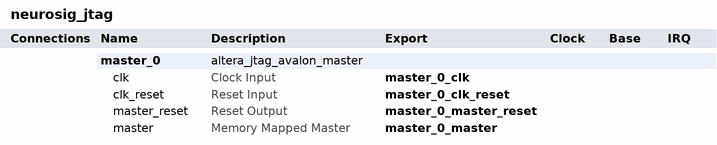
[diagram p0: system contents]
# Platform Designer (Qsys) system neurosig_jtag, Cyclone V 5CGXFC5C6F27C7
# Parameters at their usual value, and those the tool derives, are not listed.
package require -exact qsys 25.1
create_system neurosig_jtag
set_project_property DEVICE_FAMILY {Cyclone V}
set_project_property DEVICE 5CGXFC5C6F27C7

add_instance master_0 altera_jtag_avalon_master 25.1

# exported interfaces
add_interface master_0_clk clock sink
set_interface_property master_0_clk EXPORT_OF master_0.clk
add_interface master_0_clk_reset reset sink
set_interface_property master_0_clk_reset EXPORT_OF master_0.clk_reset
add_interface master_0_master avalon master
set_interface_property master_0_master EXPORT_OF master_0.master
add_interface master_0_master_reset reset source
set_interface_property master_0_master_reset EXPORT_OF master_0.master_reset

set_interconnect_requirement {$system} qsys_mm.clockCrossingAdapter HANDSHAKE
set_interconnect_requirement {$system} qsys_mm.maxAdditionalLatency 1

save_system neurosig_jtag.qsys
